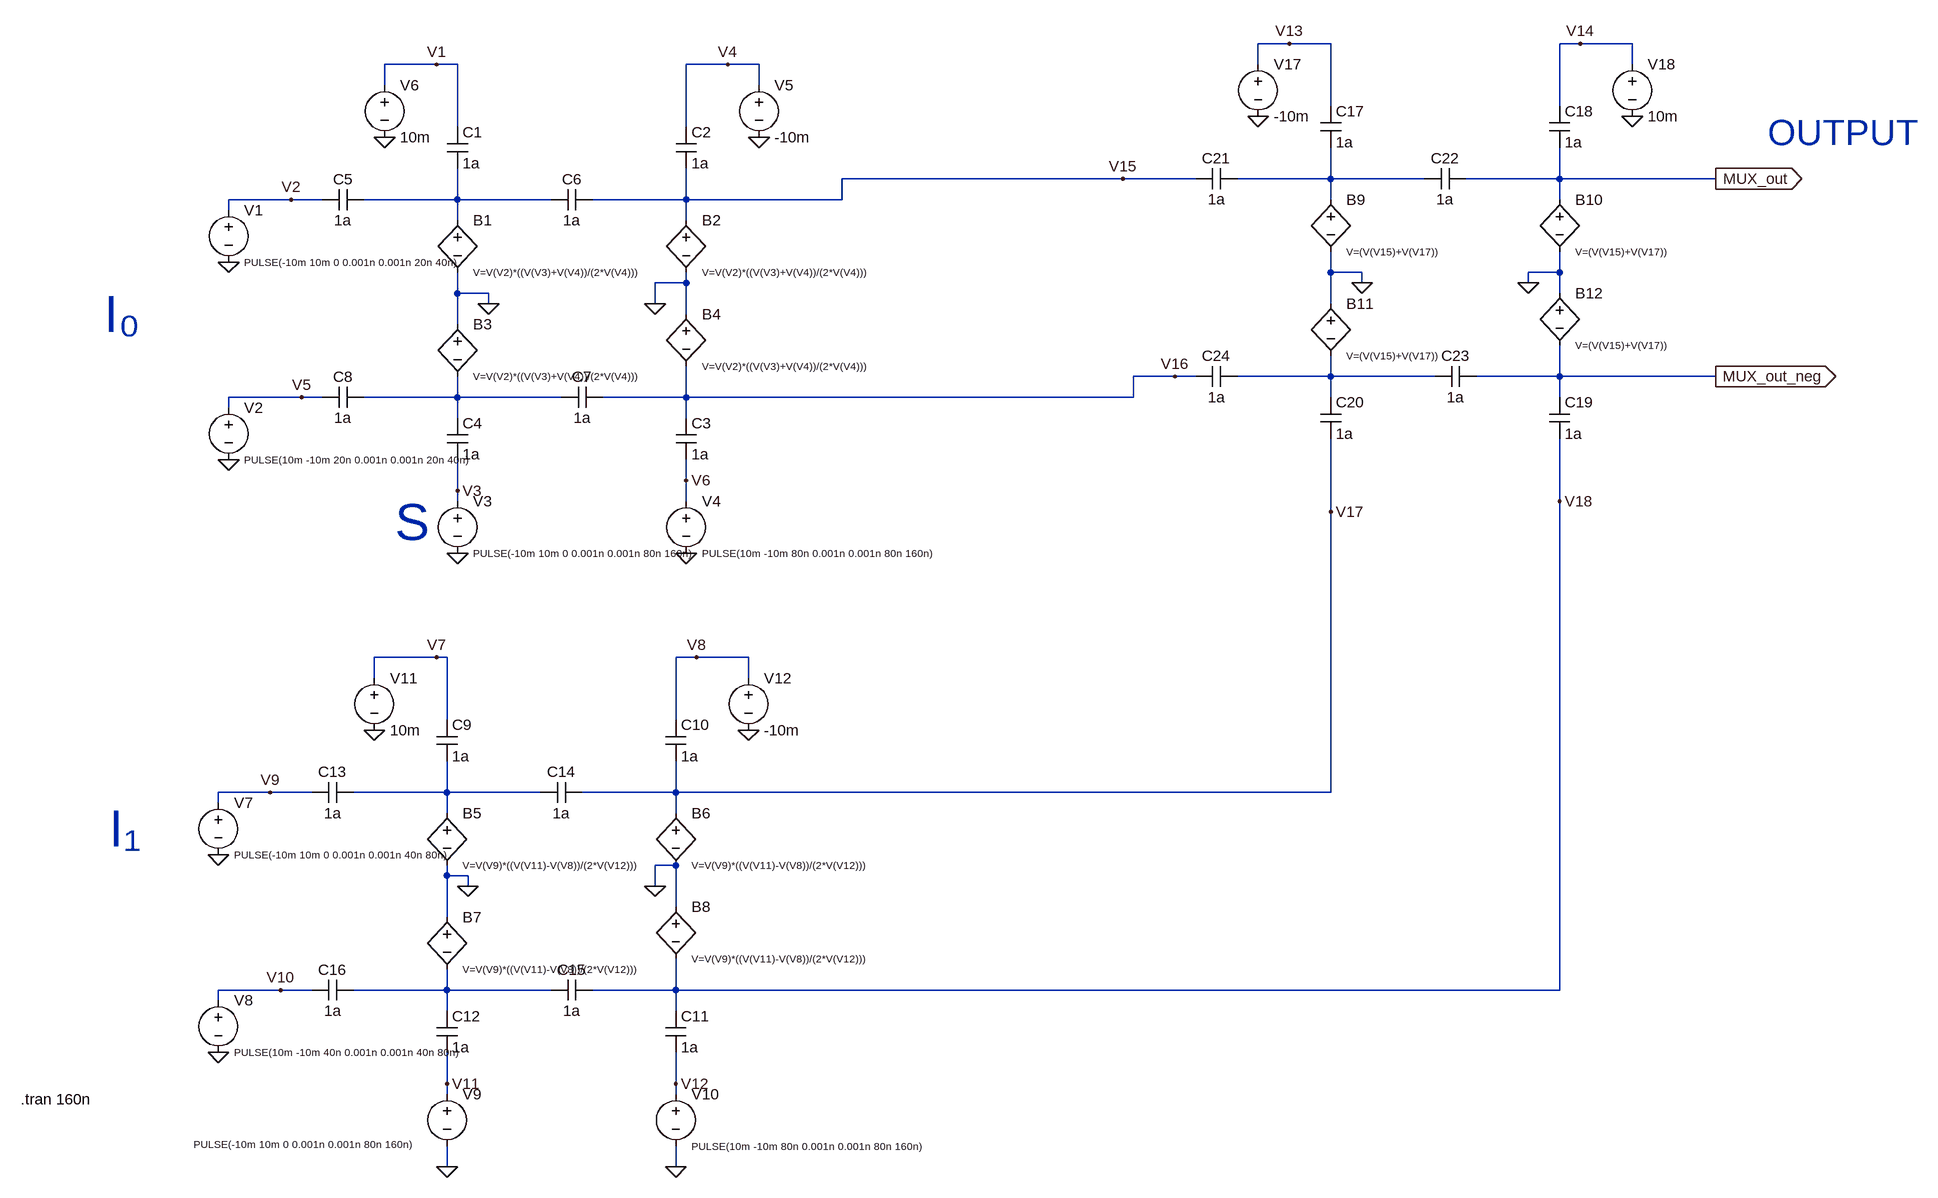
[diagram p0: schematic 2-1 Multiplexer.asc]
2-1 Multiplexer.asc, the LTspice schematic file:
Version 4.1
SHEET 1 1876 1348
WIRE 912 -400 864 -400
WIRE 976 -400 912 -400
WIRE 1360 -400 1328 -400
WIRE 1440 -400 1360 -400
WIRE -400 -368 -480 -368
WIRE -368 -368 -400 -368
WIRE 48 -368 -16 -368
WIRE 96 -368 48 -368
WIRE 864 -368 864 -400
WIRE 1440 -368 1440 -400
WIRE -480 -336 -480 -368
WIRE 96 -336 96 -368
WIRE 976 -304 976 -400
WIRE 1328 -304 1328 -400
WIRE -368 -272 -368 -368
WIRE -16 -272 -16 -368
WIRE 656 -192 224 -192
WIRE 768 -192 656 -192
WIRE 976 -192 976 -240
WIRE 976 -192 832 -192
WIRE 1120 -192 976 -192
WIRE 1328 -192 1328 -240
WIRE 1328 -192 1184 -192
WIRE 1568 -192 1328 -192
WIRE -624 -160 -720 -160
WIRE -576 -160 -624 -160
WIRE -368 -160 -368 -208
WIRE -368 -160 -512 -160
WIRE -224 -160 -368 -160
WIRE -16 -160 -16 -208
WIRE -16 -160 -160 -160
WIRE 224 -160 224 -192
WIRE 224 -160 -16 -160
WIRE 976 -160 976 -192
WIRE 1328 -160 1328 -192
WIRE -720 -144 -720 -160
WIRE -368 -128 -368 -160
WIRE -16 -128 -16 -160
WIRE 976 -48 976 -80
WIRE 1024 -48 976 -48
WIRE 1328 -48 1328 -80
WIRE 1328 -48 1280 -48
WIRE -16 -32 -16 -48
WIRE -16 -32 -64 -32
WIRE 1024 -32 1024 -48
WIRE 1280 -32 1280 -48
WIRE -368 -16 -368 -48
WIRE -320 -16 -368 -16
WIRE 1328 -16 1328 -48
WIRE -320 0 -320 -16
WIRE -64 0 -64 -32
WIRE 976 0 976 -48
WIRE -16 16 -16 -32
WIRE -368 32 -368 -16
WIRE 736 112 672 112
WIRE 768 112 736 112
WIRE 976 112 976 80
WIRE 976 112 832 112
WIRE 1136 112 976 112
WIRE 1328 112 1328 64
WIRE 1328 112 1200 112
WIRE 1568 112 1328 112
WIRE -608 144 -720 144
WIRE -576 144 -608 144
WIRE -368 144 -368 112
WIRE -368 144 -512 144
WIRE -208 144 -368 144
WIRE -16 144 -16 96
WIRE -16 144 -144 144
WIRE 672 144 672 112
WIRE 672 144 -16 144
WIRE 976 144 976 112
WIRE 1328 144 1328 112
WIRE -720 160 -720 144
WIRE -368 176 -368 144
WIRE -16 176 -16 144
WIRE -16 272 -16 240
WIRE -368 288 -368 240
WIRE -368 304 -368 288
WIRE -16 304 -16 272
WIRE 1328 304 1328 208
WIRE 976 320 976 208
WIRE -400 544 -496 544
WIRE -384 544 -400 544
WIRE 0 544 -32 544
WIRE 80 544 0 544
WIRE -496 576 -496 544
WIRE 80 576 80 544
WIRE -384 640 -384 544
WIRE -32 640 -32 544
WIRE -656 752 -736 752
WIRE -592 752 -656 752
WIRE -384 752 -384 704
WIRE -384 752 -528 752
WIRE -240 752 -384 752
WIRE -32 752 -32 704
WIRE -32 752 -176 752
WIRE 976 752 976 320
WIRE 976 752 -32 752
WIRE -736 768 -736 752
WIRE -384 784 -384 752
WIRE -32 784 -32 752
WIRE -32 864 -64 864
WIRE -384 880 -384 864
WIRE -352 880 -384 880
WIRE -352 896 -352 880
WIRE -64 896 -64 864
WIRE -32 928 -32 864
WIRE -384 944 -384 880
WIRE -640 1056 -736 1056
WIRE -592 1056 -640 1056
WIRE -384 1056 -384 1024
WIRE -384 1056 -528 1056
WIRE -224 1056 -384 1056
WIRE -32 1056 -32 1008
WIRE -32 1056 -160 1056
WIRE 1328 1056 1328 304
WIRE 1328 1056 -32 1056
WIRE -736 1072 -736 1056
WIRE -384 1088 -384 1056
WIRE -32 1088 -32 1056
WIRE -384 1200 -384 1152
WIRE -32 1200 -32 1152
WIRE -384 1216 -384 1200
WIRE -32 1216 -32 1200
WIRE -384 1328 -384 1296
WIRE -32 1328 -32 1296
FLAG -480 -256 0
FLAG -720 -64 0
FLAG -720 240 0
FLAG -368 384 0
FLAG -16 384 0
FLAG 96 -256 0
FLAG -400 -368 V1
FLAG -624 -160 V2
FLAG -608 144 V5
FLAG -368 288 V3
FLAG -16 272 V6
FLAG 48 -368 V4
FLAG -496 656 0
FLAG -736 848 0
FLAG -736 1152 0
FLAG 80 656 0
FLAG 864 -288 0
FLAG 1440 -288 0
FLAG 1568 -192 MUX_out
IOPIN 1568 -192 Out
FLAG 1568 112 MUX_out_neg
IOPIN 1568 112 Out
FLAG -400 544 V7
FLAG 0 544 V8
FLAG -656 752 V9
FLAG -640 1056 V10
FLAG -384 1200 V11
FLAG -32 1200 V12
FLAG 912 -400 V13
FLAG 1360 -400 V14
FLAG 656 -192 V15
FLAG 736 112 V16
FLAG 976 320 V17
FLAG 1328 304 V18
FLAG -320 0 0
FLAG -64 0 0
FLAG 1024 -32 0
FLAG 1280 -32 0
FLAG -352 896 0
FLAG -64 896 0
FLAG -384 1328 0
FLAG -32 1328 0
SYMBOL bv -368 -144 R0
WINDOW 3 24 96 Left 1
SYMATTR Value V=V(V2)*((V(V3)+V(V4))/(2*V(V4)))
SYMATTR InstName B1
SYMBOL bv -16 -144 R0
WINDOW 3 24 96 Left 1
SYMATTR Value V=V(V2)*((V(V3)+V(V4))/(2*V(V4)))
SYMATTR InstName B2
SYMBOL bv -368 16 R0
WINDOW 3 24 96 Left 1
SYMATTR Value V=V(V2)*((V(V3)+V(V4))/(2*V(V4)))
SYMATTR InstName B3
SYMBOL bv -16 0 R0
WINDOW 3 24 96 Left 1
SYMATTR Value V=V(V2)*((V(V3)+V(V4))/(2*V(V4)))
SYMATTR InstName B4
SYMBOL cap -384 -272 R0
SYMATTR InstName C1
SYMATTR Value 1a
SYMBOL cap -32 -272 R0
SYMATTR InstName C2
SYMATTR Value 1a
SYMBOL cap -32 176 R0
SYMATTR InstName C3
SYMATTR Value 1a
SYMBOL cap -384 176 R0
SYMATTR InstName C4
SYMATTR Value 1a
SYMBOL cap -512 -176 R90
WINDOW 0 0 32 VBottom 2
WINDOW 3 32 32 VTop 2
SYMATTR InstName C5
SYMATTR Value 1a
SYMBOL cap -160 -176 R90
WINDOW 0 0 32 VBottom 2
WINDOW 3 32 32 VTop 2
SYMATTR InstName C6
SYMATTR Value 1a
SYMBOL cap -144 128 R90
WINDOW 0 0 32 VBottom 2
WINDOW 3 32 32 VTop 2
SYMATTR InstName C7
SYMATTR Value 1a
SYMBOL cap -512 128 R90
WINDOW 0 0 32 VBottom 2
WINDOW 3 32 32 VTop 2
SYMATTR InstName C8
SYMATTR Value 1a
SYMBOL voltage -720 -160 R0
WINDOW 3 24 96 Left 1
WINDOW 123 0 0 Left 0
WINDOW 39 0 0 Left 0
SYMATTR Value PULSE(-10m 10m 0 0.001n 0.001n 20n 40n)
SYMATTR InstName V1
SYMBOL voltage -720 144 R0
WINDOW 3 24 96 Left 1
WINDOW 123 0 0 Left 0
WINDOW 39 0 0 Left 0
SYMATTR Value PULSE(10m -10m 20n 0.001n 0.001n 20n 40n)
SYMATTR InstName V2
SYMBOL voltage -368 288 R0
WINDOW 3 24 96 Left 1
WINDOW 123 0 0 Left 0
WINDOW 39 0 0 Left 0
SYMATTR Value PULSE(-10m 10m 0 0.001n 0.001n 80n 160n)
SYMATTR InstName V3
SYMBOL voltage -16 288 R0
WINDOW 3 24 96 Left 1
WINDOW 123 0 0 Left 0
WINDOW 39 0 0 Left 0
SYMATTR Value PULSE(10m -10m 80n 0.001n 0.001n 80n 160n)
SYMATTR InstName V4
SYMBOL voltage -480 -352 R0
WINDOW 123 0 0 Left 0
WINDOW 39 0 0 Left 0
SYMATTR InstName V6
SYMATTR Value 10m
SYMBOL voltage 96 -352 R0
WINDOW 123 0 0 Left 0
WINDOW 39 0 0 Left 0
SYMATTR InstName V5
SYMATTR Value -10m
SYMBOL bv -384 768 R0
WINDOW 3 24 96 Left 1
SYMATTR Value V=V(V9)*((V(V11)-V(V8))/(2*V(V12)))
SYMATTR InstName B5
SYMBOL bv -32 768 R0
WINDOW 3 24 96 Left 1
SYMATTR Value V=V(V9)*((V(V11)-V(V8))/(2*V(V12)))
SYMATTR InstName B6
SYMBOL bv -384 928 R0
WINDOW 3 24 96 Left 1
SYMATTR Value V=V(V9)*((V(V11)-V(V8))/(2*V(V12)))
SYMATTR InstName B7
SYMBOL bv -32 912 R0
WINDOW 3 24 96 Left 1
SYMATTR Value V=V(V9)*((V(V11)-V(V8))/(2*V(V12)))
SYMATTR InstName B8
SYMBOL cap -400 640 R0
SYMATTR InstName C9
SYMATTR Value 1a
SYMBOL cap -48 640 R0
SYMATTR InstName C10
SYMATTR Value 1a
SYMBOL cap -48 1088 R0
SYMATTR InstName C11
SYMATTR Value 1a
SYMBOL cap -400 1088 R0
SYMATTR InstName C12
SYMATTR Value 1a
SYMBOL cap -528 736 R90
WINDOW 0 0 32 VBottom 2
WINDOW 3 32 32 VTop 2
SYMATTR InstName C13
SYMATTR Value 1a
SYMBOL cap -176 736 R90
WINDOW 0 0 32 VBottom 2
WINDOW 3 32 32 VTop 2
SYMATTR InstName C14
SYMATTR Value 1a
SYMBOL cap -160 1040 R90
WINDOW 0 0 32 VBottom 2
WINDOW 3 32 32 VTop 2
SYMATTR InstName C15
SYMATTR Value 1a
SYMBOL cap -528 1040 R90
WINDOW 0 0 32 VBottom 2
WINDOW 3 32 32 VTop 2
SYMATTR InstName C16
SYMATTR Value 1a
SYMBOL voltage -736 752 R0
WINDOW 3 24 96 Left 1
WINDOW 123 0 0 Left 0
WINDOW 39 0 0 Left 0
SYMATTR Value PULSE(-10m 10m 0 0.001n 0.001n 40n 80n)
SYMATTR InstName V7
SYMBOL voltage -736 1056 R0
WINDOW 3 24 96 Left 1
WINDOW 123 0 0 Left 0
WINDOW 39 0 0 Left 0
SYMATTR Value PULSE(10m -10m 40n 0.001n 0.001n 40n 80n)
SYMATTR InstName V8
SYMBOL voltage -496 560 R0
WINDOW 123 0 0 Left 0
WINDOW 39 0 0 Left 0
SYMATTR InstName V11
SYMATTR Value 10m
SYMBOL voltage 80 560 R0
WINDOW 123 0 0 Left 0
WINDOW 39 0 0 Left 0
SYMATTR InstName V12
SYMATTR Value -10m
SYMBOL bv 976 -176 R0
WINDOW 3 24 96 Left 1
SYMATTR Value V=(V(V15)+V(V17))
SYMATTR InstName B9
SYMBOL bv 1328 -176 R0
WINDOW 3 24 96 Left 1
SYMATTR Value V=(V(V15)+V(V17))
SYMATTR InstName B10
SYMBOL bv 976 -16 R0
WINDOW 3 24 96 Left 1
SYMATTR Value V=(V(V15)+V(V17))
SYMATTR InstName B11
SYMBOL bv 1328 -32 R0
WINDOW 3 24 96 Left 1
SYMATTR Value V=(V(V15)+V(V17))
SYMATTR InstName B12
SYMBOL cap 960 -304 R0
SYMATTR InstName C17
SYMATTR Value 1a
SYMBOL cap 1312 -304 R0
SYMATTR InstName C18
SYMATTR Value 1a
SYMBOL cap 1312 144 R0
SYMATTR InstName C19
SYMATTR Value 1a
SYMBOL cap 960 144 R0
SYMATTR InstName C20
SYMATTR Value 1a
SYMBOL cap 832 -208 R90
WINDOW 0 0 32 VBottom 2
WINDOW 3 32 32 VTop 2
SYMATTR InstName C21
SYMATTR Value 1a
SYMBOL cap 1184 -208 R90
WINDOW 0 0 32 VBottom 2
WINDOW 3 32 32 VTop 2
SYMATTR InstName C22
SYMATTR Value 1a
SYMBOL cap 1200 96 R90
WINDOW 0 0 32 VBottom 2
WINDOW 3 32 32 VTop 2
SYMATTR InstName C23
SYMATTR Value 1a
SYMBOL cap 832 96 R90
WINDOW 0 0 32 VBottom 2
WINDOW 3 32 32 VTop 2
SYMATTR InstName C24
SYMATTR Value 1a
SYMBOL voltage 864 -384 R0
WINDOW 123 0 0 Left 0
WINDOW 39 0 0 Left 0
SYMATTR InstName V17
SYMATTR Value -10m
SYMBOL voltage 1440 -384 R0
WINDOW 123 0 0 Left 0
WINDOW 39 0 0 Left 0
SYMATTR InstName V18
SYMATTR Value 10m
SYMBOL voltage -384 1200 R0
WINDOW 3 -390 93 Left 1
WINDOW 123 0 0 Left 0
WINDOW 39 0 0 Left 0
SYMATTR Value PULSE(-10m 10m 0 0.001n 0.001n 80n 160n)
SYMATTR InstName V9
SYMBOL voltage -32 1200 R0
WINDOW 3 24 96 Left 1
WINDOW 123 0 0 Left 0
WINDOW 39 0 0 Left 0
SYMATTR Value PULSE(10m -10m 80n 0.001n 0.001n 80n 160n)
SYMATTR InstName V10
TEXT -1040 1224 Left 2 !.tran 160n
TEXT -912 16 Left 6 ;I₀
TEXT -904 808 Left 6 ;I₁
TEXT -464 336 Left 6 ;S
TEXT 1648 -264 Left 5 ;OUTPUT

The netlist it stands for:
* 2-1 Multiplexer.asc
B1 N002 0 V=V(V2)*((V(V3)+V(V4))/(2*V(V4)))
B2 V15 0 V=V(V2)*((V(V3)+V(V4))/(2*V(V4)))
B3 0 N004 V=V(V2)*((V(V3)+V(V4))/(2*V(V4)))
B4 0 V16 V=V(V2)*((V(V3)+V(V4))/(2*V(V4)))
C1 V1 N002 1a
C2 V4 V15 1a
C3 V16 V6 1a
C4 N004 V3 1a
C5 N002 V2 1a
C6 V15 N002 1a
C7 V16 N004 1a
C8 N004 V5 1a
V1 V2 0 PULSE(-10m 10m 0 0.001n 0.001n 20n 40n)
V2 V5 0 PULSE(10m -10m 20n 0.001n 0.001n 20n 40n)
V3 V3 0 PULSE(-10m 10m 0 0.001n 0.001n 80n 160n)
V4 V6 0 PULSE(10m -10m 80n 0.001n 0.001n 80n 160n)
V6 V1 0 10m
V5 V4 0 -10m
B5 N005 0 V=V(V9)*((V(V11)-V(V8))/(2*V(V12)))
B6 V17 0 V=V(V9)*((V(V11)-V(V8))/(2*V(V12)))
B7 0 N006 V=V(V9)*((V(V11)-V(V8))/(2*V(V12)))
B8 0 V18 V=V(V9)*((V(V11)-V(V8))/(2*V(V12)))
C9 V7 N005 1a
C10 V8 V17 1a
C11 V18 V12 1a
C12 N006 V11 1a
C13 N005 V9 1a
C14 V17 N005 1a
C15 V18 N006 1a
C16 N006 V10 1a
V7 V9 0 PULSE(-10m 10m 0 0.001n 0.001n 40n 80n)
V8 V10 0 PULSE(10m -10m 40n 0.001n 0.001n 40n 80n)
V11 V7 0 10m
V12 V8 0 -10m
B9 N001 0 V=(V(V15)+V(V17))
B10 MUX_out 0 V=(V(V15)+V(V17))
B11 0 N003 V=(V(V15)+V(V17))
B12 0 MUX_out_neg V=(V(V15)+V(V17))
C17 V13 N001 1a
C18 V14 MUX_out 1a
C19 MUX_out_neg V18 1a
C20 N003 V17 1a
C21 N001 V15 1a
C22 MUX_out N001 1a
C23 MUX_out_neg N003 1a
C24 N003 V16 1a
V17 V13 0 -10m
V18 V14 0 10m
V9 V11 0 PULSE(-10m 10m 0 0.001n 0.001n 80n 160n)
V10 V12 0 PULSE(10m -10m 80n 0.001n 0.001n 80n 160n)
.tran 160n
* I₀
* I₁
* S
* OUTPUT
.backanno
.end